# Altium schematic sheet Expander.SchDoc
size A3
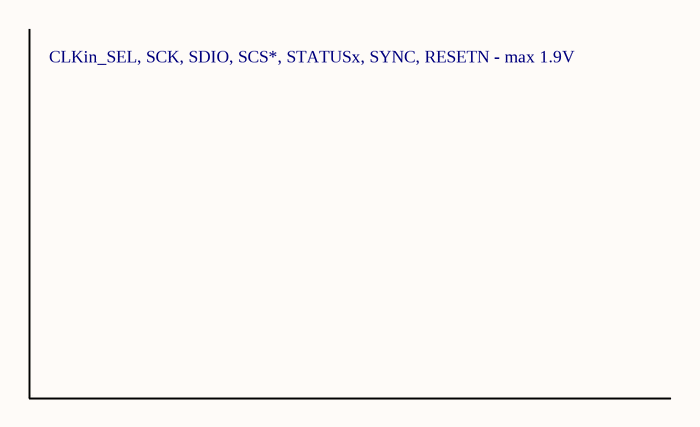
[diagram p0: Expander.SchDoc]

## Notes on the sheet
- CLKin_SEL, SCK, SDIO, SCS*, STATUSx, SYNC, RESETN - max 1.9V